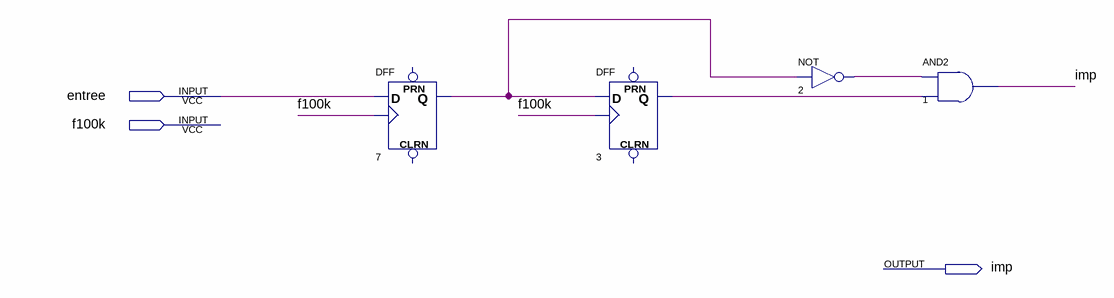
[diagram p0: schematic sheet]
// Quartus schematic detect1vers0.bdf as structural Verilog: 4 symbols, 3 pins
module detect1vers0 (
  input  entree,
  input  f100k,
  output imp
);

  wire n2_out, n3_q, n7_q;

  DFF u_7 (.CLK(f100k), .D(entree), .Q(n7_q));  // open: CLRN, PRN
  DFF u_3 (.CLK(f100k), .D(n7_q), .Q(n3_q));  // open: CLRN, PRN
  not u_2 (n2_out, n7_q);
  and u_1 (imp, n2_out, n3_q);
endmodule
